# Altium schematic sheet schematic 2 resistors controled output.SchDoc
size A4; SheetNumber: 1; SheetTotal: 1
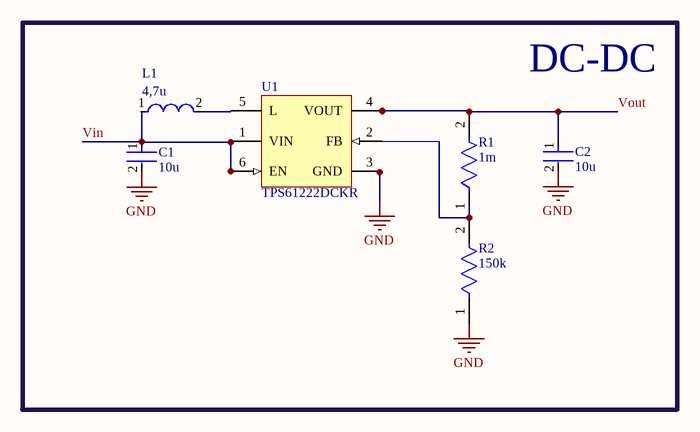
[diagram p0: schematic 2 resistors controled output.SchDoc]

## Parts
C1  10u  [FP-C0603C106M9PACTU-MFG]
C2  10u  [FP-C0603C106M9PACTU-MFG]
L1  4,7u  [FP-LQH3NPH_ME-MFG]
R1  1m  [FP-MCT0603-IPC_C]
R2  150k  [FP-MCT0603-IPC_C]
U1  TPS61222DCKR  [DCK0006A_L]

## Blocks framed on the sheet
DC-DC: C1 C2 L1 R1 R2 U1

## Nets
GND: C1.2 C2.2 R2.1 U1.3(GND)
Vin: C1.1 L1.1 U1.1(VIN) U1.6(EN)
Vout: C2.1 R1.2 U1.4(VOUT)
NetL1_2: L1.2 U1.5(L)
NetR1_1: R1.1 R2.2 U1.2(FB)

## Library data of the parts
C1 C2 = CMP-2006-02285-3: CAP CER 10UF 6.3V X5R 0603; Manufacturer Part Number: C0603C106M9PACTU; Manufacturer: Kemet; Material: Ceramic; Temperature Coefficient: 15%; Tolerance: 20%; Category: Cap; Height: 0.9mm; Digikey Description: CAP CER 10UF 6.3V X5R 0603; Mouser Description: In a Pack of 10, KEMET 0603 (1608M) 10µF MLCC 6.3V dc ±20% SMD C0603C106M9PACTU; Voltage Rating: 6.3V; Device Class L2: Capacitors; Temperature Range Low: -55°C; Temperature Characteristic: X5R; ComponentLink2Description: Datasheet; Ipc Land Pattern Name: CAPC16080X80; ComponentLink2URL: http://www.kemet.com/Lists/ProductCatalog/Attachments/19/KEM_C1006_X5R_SMD.pdf; Capacitance: 10uF; Temperature Range High: +85°C; Device Class L3: Ceramic Capacitors; RoHS: TRUE; Automotive: No; Value: 10uF; Temperature: -55°C to +85°C; Device Class L1: Passive Components; Package: C0603C106M9PACTU; Lead Free: Yes; Octopart: https://octopart.com/c0603c106m9pactu-kemet-8375727
L1 = CMP-06042-001724-1: Wire Wound Ferrite Inductor for Power Lines 4.7μH ±20% 0.12Ω 1700mA 1212; Test Frequency: 1MHz; DC Resistance (DCR): 120mR; Shielding: Shielded; Saturation Current: 1.3A; Current Rating: 1A; Inductance: 4.7uH; Self Resonant Frequency: 40MHz; Tolerance: 20%; Packaging: Cut Tape; Max Operating Temperature: 105°C; Core Material: Ferrite; Mount: Surface Mount; Resistor Type: Wirewound; Min Operating Temperature: -40°C; Case Code (Metric): 3030; Case/Package: 1212; Case Code (Imperial): 1212
R1 R2 = CMP-02407-000265-1: RES SMD 100 OHM 1% 1/8W 0603; Resistance: 1kR; Temperature Coefficient: 25ppm/°C; Tolerance: 0.5%; Max Power Dissipation: 250mW; Case Code (Metric): 1608; Case Code (Imperial): 0603; Number of Terminations: 2; Case/Package: 0603; Features: Automotive AEC-Q200; Max Operating Temperature: 175°C; Min Operating Temperature: -55°C; Composition: Thin Film; Packaging: Tape and Reel
U1 = CMP-0347-00055-2: Boost Voltage Converter with 0.7 to 5.5 V Input and 5 V Output, -40 to 85 degC, 6-Pin SC70 (DCK), Green (RoHS & no Sb/Br); Manufacturer: Texas Instruments; Vout(Min)(V): 5; SubFamily: Step-Up Regulator; Vin(Min)(V): 0.7; Switching Frequency(Max)(kHz): 2000; Regulated Outputs(#): 1; Vin(Max)(V): 5.5; Topology: Boost; Vout(Max)(V): 5; PackageVersion: revG, Jan-2007; Mounting Technology: Surface Mount; ComponentLink2URL: http://www.ti.com/litv/pdf/mpds114c; PackageReference: DCK0006A; DatasheetVersion: SLVS776; PartNumber: TPS61222DCKR; ComponentLink1Description: Datasheet; ComponentLink1URL: http://www.ti.com/general/docs/lit/getliterature.tsp?genericPartNumber=TPS61222&fileType=pdf; ComponentLink2Description: Package Specification; Eco-Plan: Green (RoHS & no Sb/Br); Code_JEDEC: MO-203-AB; PackageDescription: 6-Pin Plastic Small-Outline Package, 2 x 1.3 mm Body, 0.65 mm Pitch, 2.1 mm Lead Span